# Altium schematic sheet Top Level.SchDoc
size A; SheetNumber: 1; SheetTotal: 1
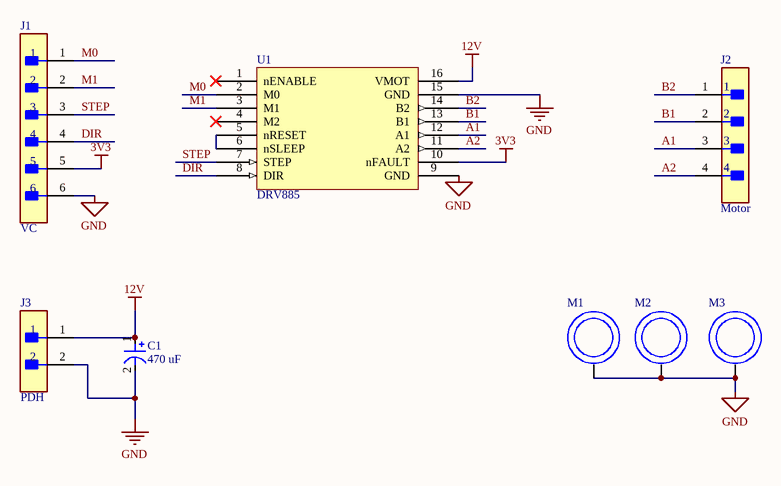
[diagram p0: Top Level.SchDoc]

## Parts
C1  470 uF  [electrolytic cap]
J1  VC  [FP-B6B-XH-AM_LF_SN-MFG]
J2  Motor  [FP-B4B-XH-A_LF_SN-MFG]
J3  PDH  [FP-B2B-XH-A_LF_SN-MFG]
M1  M2 Mounting Hole  [M2 Mounting Hole]  (value not drawn)
M2  M2 Mounting Hole  [M2 Mounting Hole]  (value not drawn)
M3  M2 Mounting Hole  [M2 Mounting Hole]  (value not drawn)
U1  DRV885  [DRV588]

## Nets
3V3: J1.5 U1.10(nFAULT)
12V: C1.1 J3.1 U1.16(VMOT)
GND: C1.2 J1.6 J3.2 M1.1 M2.1 M3.1 U1.9(GND) U1.15(GND)
A1: J2.3 U1.12(A1)
A2: J2.4 U1.11(A2)
B1: J2.2 U1.13(B1)
B2: J2.1 U1.14(B2)
DIR: J1.4 U1.8(DIR)
M0: J1.1 U1.2(M0)
M1: J1.2 U1.3(M1)
STEP: J1.3 U1.7(STEP)
NetU1_5: U1.5(nRESET) U1.6(nSLEEP)

Not connected (* = marked no-connect by the designer): U1 1(nENABLE)* 4(M2)*

## Library data of the parts
C1 = electrolytic cap
J1 = CMP-17439-000167-1: CONN HEADER VERT 6POS 2.5MM; Shape: Straight; Current Rating: 3A; Mated Stacking Heights: 9.8mm; Number of Positions: 6; Voltage Rating: 250V; Pitch: 2.5mm; Insulation Color: Natural; Number of Pins: 6; Width: 5.75mm; Flammability Rating: UL94 V-0; Packaging: Bulk; Connector Type: Header; Number of Rows: 1; Contact Plating: Copper; Mount: Through Hole; Min Operating Temperature: -25°C; Contact Type: Male Pin; Contact Shape: Square; Fastening Type: Detent; Length: 17.4mm; Series: XH; Contact Finish - Mating: TIN; Max Operating Temperature: 85°C; Insulation Material: Nylon; Number of Poles: 6; Termination: Press-Fit; Contact Material: Brass; Height: 7mm
J2 = CMP-17439-000250-1: CONN HEADER VERT 4POS 2.5MM; Number of Contacts: 4; Contact Resistance: 20mR; Voltage Rating: 250V; Max Current Rating: 3A; Gender: Male; Wire/Cable Gauge: 22AWG; Mated Stacking Heights: 9.8mm; Insulation Resistance: 1GR; Orientation: Straight; Contact Type: Male Pin; Contact Finish - Mating: TIN; Series: XH; Max Voltage Rating (AC): 250V; Lead Pitch: 2.5mm; Contact Shape: Square; Insulation Color: Natural; Termination: Solder; Lead Free: Lead Free; Voltage Rating (AC): 250V; Number of Rows: 1; Flammability Rating: UL94 V-0; Number of Positions: 4; Max Operating Temperature: 85°C; Package Quantity: 500; Mount: Through Hole; REACH SVHC: No SVHC; Connector Type: Header; Insulation Material: Nylon; Fastening Type: Detent; Min Operating Temperature: -25°C; Housing Color: White; Packaging: Bulk; Contact Plating: Tin; Contact Material: Brass; Max Voltage Rating (DC): 250V; Housing Material: Polyamide; Color: Natural; Material: Polyamide; Pitch: 2.5mm; Depth: 5.75mm; Current Rating: 3A; Length: 12.4mm
J3 = CMP-2000-05888-3: CONN HEADER VERT 2POS 2.5MM; Current Rating: 3A; Voltage Rating: 250V; Number of Contacts: 2; Contact Resistance: 20mR; Wire/Cable Gauge: 22AWG; Insulation Resistance: 1GR; Connector Type: Male Pin; Packaging: Bulk; Contact Material: Brass; Lead Free: Lead Free; Orientation: Straight; Contact Plating: Tin; Max Current Rating: 3A; Termination: Solder; Fastening Type: Detent; Depth: 5.75mm; Housing Material: Polyamide; REACH SVHC: No SVHC; Series: XH; Voltage Rating (AC): 250V; Number of Positions: 2; Color: Natural; Contact Type: Male Pin; Max Voltage Rating (DC): 250V; Pitch: 2.5mm; Lead Pitch: 2.5mm; Mount: Through Hole; Max Operating Temperature: 85°C; Length: 7.4mm; Max Voltage Rating (AC): 250V; Min Operating Temperature: -25°C; Number of Rows: 1; Housing Color: White
U1 = DRV885 Module